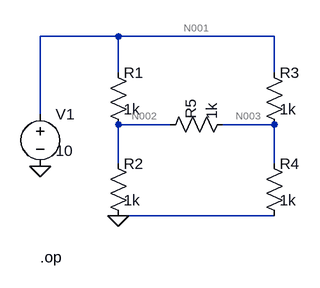
[diagram p0: schematic Ex02.asc]
Ex02.asc, the LTspice schematic file:
Version 4
SHEET 1 880 680
WIRE 60 200 60 80
WIRE 60 80 180 80
WIRE 180 80 180 136
WIRE 180 80 420 80
WIRE 420 80 420 136
WIRE 180 216 180 276
WIRE 420 216 420 276
WIRE 180 216 260 216
WIRE 340 216 420 216
WIRE 180 356 420 356
FLAG 60 280 0
FLAG 180 356 0
SYMBOL voltage 60 184 R0
WINDOW 0 24 16 Left 2
WINDOW 3 24 72 Left 2
SYMATTR InstName V1
SYMATTR Value 10
SYMBOL res 164 120 R0
WINDOW 0 24 16 Left 2
WINDOW 3 24 72 Left 2
SYMATTR InstName R1
SYMATTR Value 1k
SYMBOL res 404 120 R0
WINDOW 0 24 16 Left 2
WINDOW 3 24 72 Left 2
SYMATTR InstName R3
SYMATTR Value 1k
SYMBOL res 244 232 R270
WINDOW 0 24 48 Left 2
WINDOW 3 24 80 Left 2
SYMATTR InstName R5
SYMATTR Value 1k
SYMBOL res 164 260 R0
WINDOW 0 24 16 Left 2
WINDOW 3 24 72 Left 2
SYMATTR InstName R2
SYMATTR Value 1k
SYMBOL res 404 260 R0
WINDOW 0 24 16 Left 2
WINDOW 3 24 72 Left 2
SYMATTR InstName R4
SYMATTR Value 1k
TEXT 60 420 Left 2 !.op

The netlist it stands for:
* Ex02.asc
V1 N001 0 10
R1 N001 N002 1k
R3 N001 N003 1k
R5 N002 N003 1k
R2 N002 0 1k
R4 N003 0 1k
.op
.backanno
.end

* Results of the author's LTspice run, read from the files saved beside the schematic
* Operating Point:
*   V(n001) = 10 V
*   V(n002) = 5 V
*   V(n003) = 5 V
*   I(R1) = 5 mA
*   I(R2) = 5 mA
*   I(R3) = 5 mA
*   I(R4) = 5 mA
*   I(R5) = 0 A
*   I(V1) = -10 mA